# Altium schematic sheet WR_Clock.SchDoc: WR_Generator
size A3; Organization: Altium Limited; Address1: L3, 12a Rodborough Rd; Address2: Frenchs Forest; Address3: NSW; Address4: Australia 2086
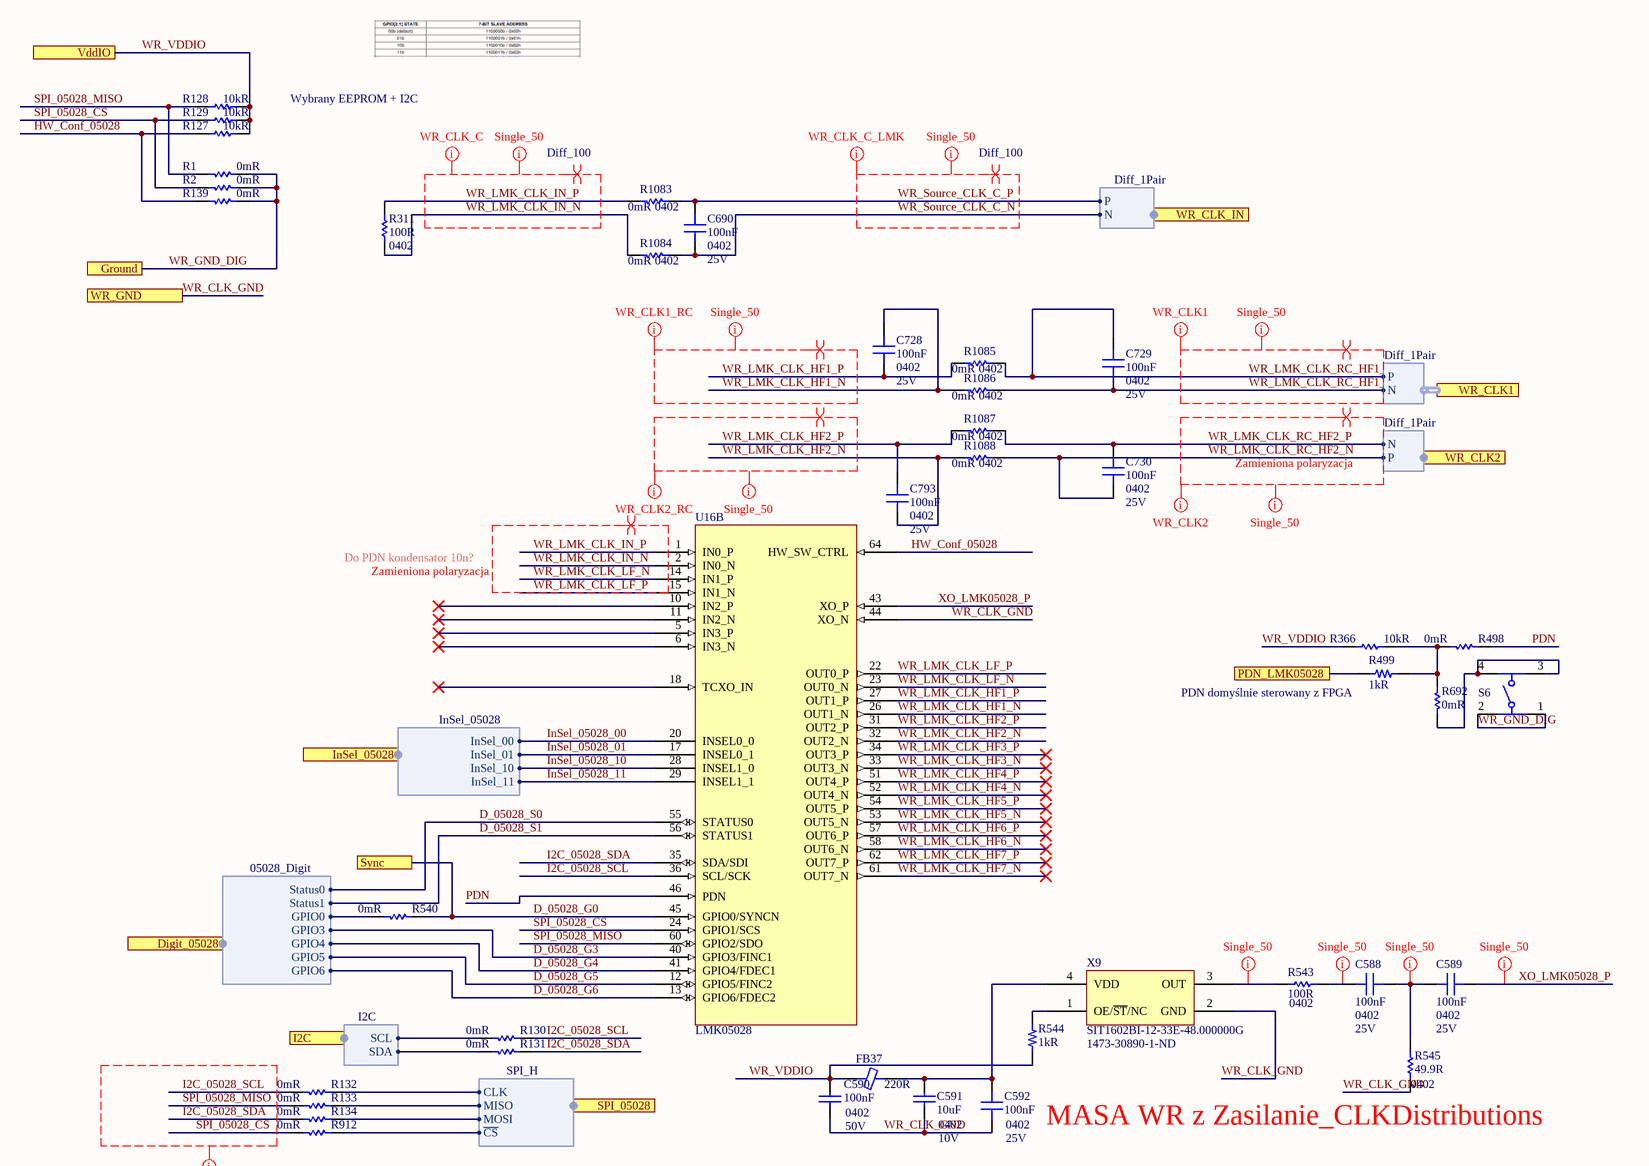
[diagram p0: WR_Clock.SchDoc]

## Parts
C588  100nF  Case/Package: 0402  Voltage Rating: 25V  [CAP 0402/1005 KK]
C589  100nF  Case/Package: 0402  Voltage Rating: 25V  [CAP 0402/1005 KK]
C590  100nF  Case Code (Imperial): 0402  Voltage: 50V  [CAP 0402/1005 KK]
C591  10uF  Case/Package: 0402  Voltage Rating: 10V  [CAP 0402/1005 KK]
C592  100nF  Case/Package: 0402  Voltage Rating: 25V  [CAP 0402/1005 KK]
C690  100nF  Case/Package: 0402  Voltage Rating: 25V  [CAP 0402/1005 KK]
C728  100nF  Case/Package: 0402  Voltage Rating: 25V  [CAP 0402/1005 KK]
C729  100nF  Case/Package: 0402  Voltage Rating: 25V  [CAP 0402/1005 KK]
C730  100nF  Case/Package: 0402  Voltage Rating: 25V  [CAP 0402/1005 KK]
C793  100nF  Case/Package: 0402  Voltage Rating: 25V  [CAP 0402/1005 KK]
FB37  220R  [FER 0603/1608]
R1  0mR  [RES 0402/1005 RF KK]
R2  0mR  [RES 0402/1005 RF KK]
R127  10kR  [RES 0402/1005 RF KK]
R128  10kR  [RES 0402/1005 RF KK]
R129  10kR  [RES 0402/1005 RF KK]
R130  0mR  [RES 0402/1005 RF KK]
R131  0mR  [RES 0402/1005 RF KK]
R132  0mR  [RES 0402/1005 RF KK]
R133  0mR  [RES 0402/1005 RF KK]
R134  0mR  [RES 0402/1005 RF KK]
R139  0mR  [RES 0402/1005 RF KK]
R311  100R  Case/Package: 0402  [RES 0402/1005 RF KK]
R366  10kR  [RES 0402/1005 RF KK]
R498  0mR  [RES 0402/1005 RF KK]
R499  1kR  [RES 0402/1005 RF KK]
R540  0mR  [RES 0402/1005 RF KK]
R543  100R  Case/Package: 0402  [RES 0402/1005 RF KK]
R544  1kR  [RES 0402/1005 RF KK]
R545  49.9R  Case/Package: 0402  [RES 0402/1005 RF KK]
R692  0mR  [RES 0402/1005 RF KK]
R912  0mR  [RES 0402/1005 RF KK]
R1083  0mR  Case/Package: 0402  [RES 0402/1005 RF KK]
R1084  0mR  Case/Package: 0402  [RES 0402/1005 RF KK]
R1085  0mR  Case/Package: 0402  [RES 0402/1005 RF KK]
R1086  0mR  Case/Package: 0402  [RES 0402/1005 RF KK]
R1087  0mR  Case/Package: 0402  [RES 0402/1005 RF KK]
R1088  0mR  Case/Package: 0402  [RES 0402/1005 RF KK]
S6  430181038816  [430181038816]  (value not drawn)
U16  LMK05028  [LMK05028]  (part B of 2)
X9  SIT1602BI-12-33E-48.000000G  Supplier Part Number 1: 1473-30890-1-ND  [SiT1602B]

## Ports
Digit_05028 (harness 05028_Digit), Ground, I2C (harness I2C), InSel_05028 (harness InSel_05028), PDN_LMK05028, SPI_05028 (harness SPI_H), Sync, VddIO, WR_CLK1 (harness Diff_1Pair), WR_CLK2 (harness Diff_1Pair), WR_CLK_IN (harness Diff_1Pair), WR_GND

## Harnesses
SPI_H: CLK, MISO, MOSI, ~{CS}
I2C: SDA, SCL
05028_Digit: GPIO4, GPIO3, Status0, GPIO6, Status1, GPIO5, GPIO0
Diff_1Pair: N, P
InSel_05028: InSel_00, InSel_01, InSel_10, InSel_11

## Nets
D_05028_G0: R540.1 U16.45(GPIO0/SYNCN) ; port Sync
D_05028_G3: U16.40(GPIO3/FINC1) ; port Digit_05028.GPIO3
D_05028_G4: U16.41(GPIO4/FDEC1) ; port Digit_05028.GPIO4
D_05028_G5: U16.12(GPIO5/FINC2) ; port Digit_05028.GPIO5
D_05028_G6: U16.13(GPIO6/FDEC2) ; port Digit_05028.GPIO6
D_05028_S0: U16.55(STATUS0) ; port Digit_05028.Status0
D_05028_S1: U16.56(STATUS1) ; port Digit_05028.Status1
HW_Conf_05028: R127.1 R139.2 U16.64(HW_SW_CTRL)
I2C_05028_SCL: R130.1 R132.2 U16.36(SCL/SCK)
I2C_05028_SDA: R131.1 R134.2 U16.35(SDA/SDI)
InSel_05028_00: U16.20(INSEL0_0) ; port InSel_05028.InSel_00
InSel_05028_01: U16.17(INSEL0_1) ; port InSel_05028.InSel_01
InSel_05028_10: U16.28(INSEL1_0) ; port InSel_05028.InSel_10
InSel_05028_11: U16.29(INSEL1_1) ; port InSel_05028.InSel_11
PDN: R498.1 U16.46(PDN)
PDN_LMK05028: R499.1 ; port PDN_LMK05028
SPI_05028_CS: R2.2 R129.1 R912.2 U16.24(GPIO1/SCS)
SPI_05028_MISO: R1.2 R128.1 R133.2 U16.60(GPIO2/SDO)
WR_CLK_GND: C590.1 C591.1 C592.1 R545.1 U16.44(XO_N) X9.2(GND) ; port WR_GND
WR_GND_DIG: R1.1 R2.1 R139.1 S6.1 S6.2 ; port Ground
WR_LMK_CLK_HF1_N: C728.1 R1086.2 U16.26(OUT1_N)
WR_LMK_CLK_HF1_P: C728.2 R1085.2 U16.27(OUT1_P)
WR_LMK_CLK_HF2_N: C793.2 R1088.2 U16.32(OUT2_N)
WR_LMK_CLK_HF2_P: C793.1 R1087.2 U16.31(OUT2_P)
WR_LMK_CLK_HF3_N: U16.33(OUT3_N)
WR_LMK_CLK_HF3_P: U16.34(OUT3_P)
WR_LMK_CLK_HF4_N: U16.52(OUT4_N)
WR_LMK_CLK_HF4_P: U16.51(OUT4_P)
WR_LMK_CLK_HF5_N: U16.53(OUT5_N)
WR_LMK_CLK_HF5_P: U16.54(OUT5_P)
WR_LMK_CLK_HF6_N: U16.58(OUT6_N)
WR_LMK_CLK_HF6_P: U16.57(OUT6_P)
WR_LMK_CLK_HF7_N: U16.61(OUT7_N)
WR_LMK_CLK_HF7_P: U16.62(OUT7_P)
WR_LMK_CLK_IN_N: R311.1 R1084.2 U16.2(IN0_N)
WR_LMK_CLK_IN_P: R311.2 R1083.2 U16.1(IN0_P)
WR_LMK_CLK_LF_N: U16.14(IN1_P) U16.23(OUT0_N)
WR_LMK_CLK_LF_P: U16.15(IN1_N) U16.22(OUT0_P)
WR_LMK_CLK_RC_HF1_N: C729.2 R1086.1 ; port WR_CLK1.N
WR_LMK_CLK_RC_HF1_P: C729.1 R1085.1 ; port WR_CLK1.P
WR_LMK_CLK_RC_HF2_N: C730.2 R1088.1 ; port WR_CLK2.P
WR_LMK_CLK_RC_HF2_P: C730.1 R1087.1 ; port WR_CLK2.N
WR_Source_CLK_C_N: C690.2 R1084.1 ; port WR_CLK_IN.N
WR_Source_CLK_C_P: C690.1 R1083.1 ; port WR_CLK_IN.P
WR_VDDIO: C590.2 FB37.1 R127.2 R128.2 R129.2 R366.1 R544.2 ; port VddIO
XO_LMK05028_P: C589.1 U16.43(XO_P)
NetC588_1: C588.1 C589.2 R545.2
NetC588_2: C588.2 R543.2
NetC591_2: C591.2 C592.2 FB37.2 X9.4(VDD)
NetR130_2: R130.2 ; port I2C.SCL
NetR131_2: R131.2 ; port I2C.SDA
NetR132_1: R132.1 ; port SPI_05028.CLK
NetR133_1: R133.1 ; port SPI_05028.MISO
NetR134_1: R134.1 ; port SPI_05028.MOSI
NetR366_2: R366.2 R498.2 R499.2 R692.1
NetR540_2: R540.2 ; port Digit_05028.GPIO0
NetR543_1: R543.1 X9.3(OUT)
NetR544_1: R544.1 X9.1(OE/~{ST}/NC)
NetR692_2: R692.2 S6.3 S6.4
NetR912_1: R912.1 ; port SPI_05028.~{CS}

Not connected (* = marked no-connect by the designer): U16 5(IN3_P)* 6(IN3_N)* 10(IN2_P)* 11(IN2_N)* 18(TCXO_IN)*

## Layout directives
net class Single_50: NetC588_1, NetC588_2, NetR543_1, WR_LMK_CLK_HF1_N, WR_LMK_CLK_HF1_P, WR_LMK_CLK_HF2_N, WR_LMK_CLK_HF2_P, WR_LMK_CLK_IN_N, WR_LMK_CLK_IN_P, WR_LMK_CLK_RC_HF1_N, WR_LMK_CLK_RC_HF1_P, WR_LMK_CLK_RC_HF2_N, WR_LMK_CLK_RC_HF2_P, WR_Source_CLK_C_N, WR_Source_CLK_C_P, XO_LMK05028_P
net class WR_CLK1: WR_LMK_CLK_RC_HF1_N, WR_LMK_CLK_RC_HF1_P
net class WR_CLK2: WR_LMK_CLK_RC_HF2_N, WR_LMK_CLK_RC_HF2_P
net class WR_CLK_C_LMK: WR_Source_CLK_C_N, WR_Source_CLK_C_P
differential pair; differential pair class Diff_100: WR_LMK_CLK_HF1_N, WR_LMK_CLK_HF1_P, WR_LMK_CLK_HF2_N, WR_LMK_CLK_HF2_P, WR_LMK_CLK_IN_N, WR_LMK_CLK_IN_P, WR_LMK_CLK_LF_N, WR_LMK_CLK_LF_P, WR_LMK_CLK_RC_HF1_N, WR_LMK_CLK_RC_HF1_P, WR_LMK_CLK_RC_HF2_N, WR_LMK_CLK_RC_HF2_P, WR_Source_CLK_C_N, WR_Source_CLK_C_P
net class WR_CLK_C: WR_LMK_CLK_IN_N, WR_LMK_CLK_IN_P
net class WR_CLK2_RC: WR_LMK_CLK_HF2_N, WR_LMK_CLK_HF2_P
net class WR_CLK1_RC: WR_LMK_CLK_HF1_N, WR_LMK_CLK_HF1_P
net class SPI_05028: I2C_05028_SCL, I2C_05028_SDA, SPI_05028_CS, SPI_05028_MISO

## Notes on the sheet
- Wybrany EEPROM + I2C
- Zamieniona polaryzacja
- Do PDN kondensator 10n?
- (near R499) PDN domyślnie sterowany z FPGA
- (near R545) MASA WR z Zasilanie_CLKDistributions
- Title
- Size:
- Date:
- A3
- Number:
- Time:
- Revision:
- Sheet
- of
- File:

## Library data of the parts
C588 C589 C592 C690 C728-C730 C793 = Capacitor: Manufacturer: Murata; Manufacturer Part Number: GRM155R71E104KE14J; Tolerance: 10%; Dielectric: X7R; Supplier 1: Digi-Key; Supplier Part Number 1: 490-14603-1-ND; Stock 1: 89275; Pricing 1: 1 = 0,10000, 10 = 0,03400, 100 = 0,01520, 500 = 0,01088, 1000 = 0,00855, 2500 = 0,00778, 5000 = 0,00715 (USD); RoHS: Yes; Mount: Surface Mount; Weight: 0.000212oz; Case Code (Imperial): 0402; Case Code (Metric): 1005; Min Operating Temperature: -55°C; Max Operating Temperature: 125°C; Packaging: Tape and Reel; Capacitance: 100nF; Termination: SMD/SMT; Composition: Ceramic; Voltage Rating (DC): 25V; Package Quantity: 50000; Length: 0.039inch; Height: 0.5mm; Width: 0.5mm; Thickness: 0.022inch; ComponentLink1URL: http://www.mouser.com/ds/2/281/c02e-2905.pdf?src-supplier=Mouser; ComponentLink1Description: http://www.mouser.com/ds/2/281/c02e-2905.pdf?src-supplier=Mouser; ComponentLink2URL: http://search.murata.co.jp/Ceramy/image/img/A01X/G101/ENG/GRM155R71E104KE14-01.pdf?src-supplier=Digi-Key; ComponentLink2Description: http://search.murata.co.jp/Ceramy/image/img/A01X/G101/ENG/GRM155R71E104KE14-01.pdf?src-supplier=Digi-Key
C590 = Capacitor: CAP CER 0.1UF 50V X5R 0402; Manufacturer: Murata; Manufacturer Part Number: GRM155R61H104KE14D; Dielectric Material: Ceramic; Dissipation Factor: 0.025%; Tolerance: 10%; Supplier 1: Digi-Key; Supplier Part Number 1: 490-10697-1-ND; RoHS: Yes; Category: Ceramic Capacitors; Stock 1: 435607; Pricing 1: 1=0,10000, 10=0,04600, 100=0,02050, 500=0,01464, 1000=0,01150, 2500=0,01045, 5000=0,00961 (USD); Mount: Surface Mount; Case/Package: 0402; Weight: 0.000212oz; Case Code (Metric): 1005; Min Operating Temperature: -55°C; Max Operating Temperature: 85°C; Capacitance: 100nF; Packaging: Tape and Reel; Voltage Rating: 50V; Dielectric: X5R; Termination: SMD/SMT; Composition: Ceramic; Voltage Rating (DC): 50V; Package Quantity: 10000; Length: 1mm; Height: 0.5mm; Width: 0.02inch; Thickness: 0.022inch; Depth: 0.5mm; REACH SVHC: No SVHC; Lead Free: Lead Free; ComponentLink1URL: http://www.farnell.com/datasheets/2079150.pdf?src-supplier=Farnell; ComponentLink1Description: http://www.farnell.com/datasheets/2079150.pdf?src-supplier=Farnell; ComponentLink2URL: http://www.mouser.com/ds/2/281/c02e-2905.pdf?src-supplier=Mouser; ComponentLink2Description: http://www.mouser.com/ds/2/281/c02e-2905.pdf?src-supplier=Mouser; ComponentLink3URL: http://www.farnell.com/datasheets/2079150.pdf?src-supplier=Element14; ComponentLink3Description: http://www.farnell.com/datasheets/2079150.pdf?src-supplier=Element14; ComponentLink4URL: http://search.murata.co.jp/Ceramy/image/img/A01X/G101/ENG/GRM155R61H104KE14-01.pdf?src-supplier=Digi-Key; ComponentLink4Description: http://search.murata.co.jp/Ceramy/image/img/A01X/G101/ENG/GRM155R61H104KE14-01.pdf?src-supplier=Digi-Key
C591 = Capacitor: CAP CER 10UF 10V X5R 0402; Manufacturer: Samsung; Manufacturer Part Number: CL05A106MP8NUB8; Tolerance: 20%; Supplier 1: Digi-Key; Supplier Part Number 1: 1276-6830-1-ND; RoHS: Yes; Category: Ceramic Capacitors; Stock 1: 996737; Pricing 1: 1=0,47000, 10=0,32400, 100=0,19410, 500=0,14558, 1000=0,12293, 2500=0,11646 (USD); Mount: Surface Mount; Case Code (Metric): 1005; Case Code (Imperial): 0402; Min Operating Temperature: -55°C; Max Operating Temperature: 85°C; Packaging: Tape and Reel; Capacitance: 10uF; Length: 0.039inch; Width: 0.02inch; Thickness: 0.035inch; ComponentLink1URL: http://www.samsungsem.com/kr/support/product-search/mlcc/CL05A106MP8NUB8.jsp?src-supplier=Digi-Key; ComponentLink1Description: http://www.samsungsem.com/kr/support/product-search/mlcc/CL05A106MP8NUB8.jsp?src-supplier=Digi-Key
FB37 = Ferrite: FERRITE BEAD 220 OHM 0603 1LN; Manufacturer: Murata; Manufacturer Part Number: BLM18SG221TN1D; Material: Ferrite,Steel; Tolerance: 25%; Max Current Rating: 2.5A; Number of Lines: 1; DC Resistance (DCR): 40mR; Test Frequency: 100MHz; Supplier 1: Digi-Key; Supplier Part Number 1: 490-5225-1-ND; RoHS: Yes; Category: Inductors; Stock 1: 123623; Pricing 1: 1=0,14000, 10=0,11600, 25=0,09040, 50=0,07500, 100=0,06460, 250=0,05172, 500=0,04654, 1000=0,03878, 5000=0,03619 (USD); Case/Package: 0603; Number of Pins: 2; Weight: 7.1E-05oz; Core Material: Ferrite; Case Code (Metric): 1608; Case Code (Imperial): 0603; Min Operating Temperature: -55°C; Max Operating Temperature: 125°C; Package Quantity: 1; Impedance: 220R; Packaging: Tape and Reel; Current Rating: 2.5A; Termination: SMD/SMT; Max DC Current: 2.5A; DC Current: 2.5A; Number of Circuits: 1; Length: 1.6mm; Height: 0.8mm; Width: 0.8mm; Depth: 0.95mm; Radiation Hardening: No; REACH SVHC: No SVHC; Lead Free: Lead Free; ComponentLink1URL: https://datasheet.ciiva.com/1561/c31e-1561456.pdf?src-supplier=Newark; ComponentLink1Description: https://datasheet.ciiva.com/1561/c31e-1561456.pdf?src-supplier=Newark; ComponentLink2URL: https://datasheet.ciiva.com/41449/001171724-da-01-en-chip-drossel0603-220r-2500ma-1-6x0-8mm-41449352.pdf?src-supplier=Conrad; ComponentLink2Description: https://datasheet.ciiva.com/41449/001171724-da-01-en-chip-drossel0603-220r-2500ma-1-6x0-8mm-41449352.pdf?src-supplier=Conrad; ComponentLink3URL: https://datasheet.ciiva.com/41449/001172313-da-01-en-drossel-0603-220r-21-6x0-8mm-10000st-41449677.pdf?src-supplier=Conrad; ComponentLink3Description: https://datasheet.ciiva.com/41449/001172313-da-01-en-drossel-0603-220r-21-6x0-8mm-10000st-41449677.pdf?src-supplier=Conrad; ComponentLink4URL: https://datasheet.ciiva.com/1012/l0110s0100blm18s-1012626.pdf?src-supplier=Digi-Key; ComponentLink4Description: https://datasheet.ciiva.com/1012/l0110s0100blm18s-1012626.pdf?src-supplier=Digi-Key; ComponentLink5URL: https://datasheet.ciiva.com/1012/l0110s0100blm18s-1012627.pdf?src-supplier=Digi-Key; ComponentLink5Description: https://datasheet.ciiva.com/1012/l0110s0100blm18s-1012627.pdf?src-supplier=Digi-Key; ComponentLink6URL: https://datasheet.ciiva.com/1012/l0110s0100blm18s-1012628.pdf?src-supplier=Digi-Key; ComponentLink6Description: https://datasheet.ciiva.com/1012/l0110s0100blm18s-1012628.pdf?src-supplier=Digi-Key; ComponentLink7URL: https://datasheet.ciiva.com/17279/l0110s0100blm18s-17279573.pdf?src-supplier=Avnet+Europe; ComponentLink7Description: https://datasheet.ciiva.com/17279/l0110s0100blm18s-17279573.pdf?src-supplier=Avnet+Europe; ComponentLink8URL: https://datasheet.ciiva.com/8508/l0110s0100blm18s-8508310.pdf?src-supplier=Avnet; ComponentLink8Description: https://datasheet.ciiva.com/8508/l0110s0100blm18s-8508310.pdf?src-supplier=Avnet; ComponentLink9URL: https://datasheet.ciiva.com/8021/5151-8021517.pdf?src-supplier=Element14; ComponentLink9Description: https://datasheet.ciiva.com/8021/5151-8021517.pdf?src-supplier=Element14; ComponentLink10URL: https://datasheet.ciiva.com/16204/l0110s0100blm18s-16204029.pdf?src-supplier=Future+Electronics; ComponentLink10Description: https://datasheet.ciiva.com/16204/l0110s0100blm18s-16204029.pdf?src-supplier=Future+Electronics; ComponentLink11URL: https://datasheet.ciiva.com/14122/blm-series-eng-tds-14122910.pdf?src-supplier=Distrelec; ComponentLink11Description: https://datasheet.ciiva.com/14122/blm-series-eng-tds-14122910.pdf?src-supplier=Distrelec; ComponentLink12URL: https://datasheet.ciiva.com/8021/5151-8021519.pdf?src-supplier=Element14; ComponentLink12Description: https://datasheet.ciiva.com/8021/5151-8021519.pdf?src-supplier=Element14
R1 R2 R130-R134 R139 R498 R540 R692 R912 R1083-R1088 = Resistor: Manufacturer 1: Yageo; Manufacturer Part Number 1: RC0402JR-070RL; Power Rating: 62.5mW; Tolerance: 5%; Voltage Rating: 50V; Max Power Dissipation: 63mW; Temperature Coefficient: 200ppm/°C; Supplier 1: Digi-Key; Supplier Part Number 1: 311-0.0JRCT-ND; Stock 1: 69822252; Pricing 1: 1=0.10000, 10=0.01200, 25=0.00920, 50=0.00680, 100=0.00510, 250=0.00388, 500=0.00308, 1000=0.00227, 5000=0.00163 (USD); RoHS: Yes; Contact Plating: Tin,Matte; Case Code (Metric): 1005; Case Code (Imperial): 0402; Min Operating Temperature: -55°C; Max Operating Temperature: 155°C; Resistance: 0mR; Packaging: Tape and Reel; Composition: Thick Film; Package Quantity: 1; Number of Terminations: 2; Termination: SMD/SMT; Military Standard: Not; Features: Moisture Resistant; Length: 1mm; Height: 0.016inch; Width: 0.02inch; Depth: 0.5mm; Radiation Hardening: No; REACH SVHC: Unknown; Lead Free: Lead Free; ComponentLink1URL: https://datasheet.ciiva.com/2452/pyu-rc0402-51-rohs-l-6-2452608.pdf?src-supplier=Digi-Key; ComponentLink1Description: https://datasheet.ciiva.com/2452/pyu-rc0402-51-rohs-l-6-2452608.pdf?src-supplier=Digi-Key; ComponentLink2URL: https://datasheet.ciiva.com/11808/0900766b80c66297-11808195.pdf?src-supplier=RSComponents; ComponentLink2Description: https://datasheet.ciiva.com/11808/0900766b80c66297-11808195.pdf?src-supplier=RSComponents; ComponentLink3URL: https://datasheet.ciiva.com/2452/pyu-r-int-thick-7-2452609.pdf?src-supplier=Digi-Key; ComponentLink3Description: https://datasheet.ciiva.com/2452/pyu-r-int-thick-7-2452609.pdf?src-supplier=Digi-Key; ComponentLink4URL: https://datasheet.ciiva.com/22747/1018594-22747515.pdf?src-supplier=Element14; ComponentLink4Description: https://datasheet.ciiva.com/22747/1018594-22747515.pdf?src-supplier=Element14; ComponentLink5URL: https://datasheet.ciiva.com/7983/1018594-7983535.pdf?src-supplier=Element14; ComponentLink5Description: https://datasheet.ciiva.com/7983/1018594-7983535.pdf?src-supplier=Element14; ComponentLink6URL: https://datasheet.ciiva.com/2452/pyu-r-int-thick-7-2452610.pdf?src-supplier=Digi-Key; ComponentLink6Description: https://datasheet.ciiva.com/2452/pyu-r-int-thick-7-2452610.pdf?src-supplier=Digi-Key; ComponentLink7URL: https://datasheet.ciiva.com/8896/pyu-rc0402-51-rohs-l-6-8896201.pdf?src-supplier=Avnet; ComponentLink7Description: https://datasheet.ciiva.com/8896/pyu-rc0402-51-rohs-l-6-8896201.pdf?src-supplier=Avnet; ComponentLink8URL: https://datasheet.ciiva.com/28386/pyu-rc0402-51-rohs-l-6-28386633.pdf?src-supplier=Avnet+Europe; ComponentLink8Description: https://datasheet.ciiva.com/28386/pyu-rc0402-51-rohs-l-6-28386633.pdf?src-supplier=Avnet+Europe; ComponentLink9URL: https://datasheet.ciiva.com/15189/getdatasheetpartid-326379-15189533.pdf?src-supplier=Verical; ComponentLink9Description: https://datasheet.ciiva.com/15189/getdatasheetpartid-326379-15189533.pdf?src-supplier=Verical
  R1 R2 R130-R134 R139 R498 R540 R692 R912: Case/Package: 0402
R127-R129 R366 = Resistor: Manufacturer 1: Yageo; Manufacturer Part Number 1: RC0402FR-0710KL; Tolerance: 1%; Temperature Coefficient: 100ppm/°C; Voltage Rating: 50V; Power Rating: 62.5mW; Supplier 1: Digi-Key; Supplier Part Number 1: 311-10.0KLRCT-ND; Stock 1: 71214322; Pricing 1: 1=0,10000, 10=0,01500, 100=0,00600, 1000=0,00270, 2500=0,00235, 5000=0,00194 (USD); RoHS: Yes; Case/Package: 0402; Number of Pins: 2; Case Code (Imperial): 0402; Case Code (Metric): 1005; Min Operating Temperature: -55°C; Max Operating Temperature: 155°C; Resistance: 10kR; Packaging: Tape and Reel; Composition: Thick Film; Voltage Rating (DC): 50V; Termination: SMD/SMT; Military Standard: Not; Working Voltage: 50V; Number of Terminations: 2; Length: 1mm; Height: 0.32mm; Width: 0.5mm; Depth: 0.5mm; Lead Pitch: 0.2mm; REACH SVHC: No SVHC; Lead Free: Lead Free; ComponentLink1URL: https://datasheet.ciiva.com/7660/38568-7660787.pdf?src-supplier=Element14; ComponentLink1Description: https://datasheet.ciiva.com/7660/38568-7660787.pdf?src-supplier=Element14; ComponentLink2URL: https://datasheet.ciiva.com/7849/1784430-7849813.pdf?src-supplier=Element14; ComponentLink2Description: https://datasheet.ciiva.com/7849/1784430-7849813.pdf?src-supplier=Element14; ComponentLink3URL: https://datasheet.ciiva.com/7849/1686128-7849814.pdf?src-supplier=Element14; ComponentLink3Description: https://datasheet.ciiva.com/7849/1686128-7849814.pdf?src-supplier=Element14; ComponentLink4URL: https://datasheet.ciiva.com/7849/1784430-7849815.pdf?src-supplier=Element14; ComponentLink4Description: https://datasheet.ciiva.com/7849/1784430-7849815.pdf?src-supplier=Element14; ComponentLink5URL: https://datasheet.ciiva.com/22747/1018594-22747512.pdf?src-supplier=Element14; ComponentLink5Description: https://datasheet.ciiva.com/22747/1018594-22747512.pdf?src-supplier=Element14; ComponentLink6URL: https://datasheet.ciiva.com/12667/pyu-rc0402-51-rohs-l-6-r-12667067.pdf?src-supplier=Mouser; ComponentLink6Description: https://datasheet.ciiva.com/12667/pyu-rc0402-51-rohs-l-6-r-12667067.pdf?src-supplier=Mouser; ComponentLink7URL: https://datasheet.ciiva.com/7983/1018594-7983486.pdf?src-supplier=Element14; ComponentLink7Description: https://datasheet.ciiva.com/7983/1018594-7983486.pdf?src-supplier=Element14
R311 R543 = Resistor: RES SMD 100 OHM 1% 1/16W 0402; Manufacturer: Yageo; Manufacturer Part Number: RC0402FR-07100RL; Power Rating: 62.5mW; Voltage Rating: 50V; Temperature Coefficient: 100ppm/°C; Supplier 1: Digi-Key; Supplier Part Number 1: 311-100LRDKR-ND; RoHS: Yes; Category: Chip SMD Resistors; Stock 1: 42078262; Pricing 1: 1=0,10000, 10=0,01600, 100=0,00640, 1000=0,00289, 2500=0,00251, 5000=0,00207 (USD); Number of Pins: 2; Case Code (Imperial): 0402; Case Code (Metric): 1005; Min Operating Temperature: -55°C; Max Operating Temperature: 155°C; Tolerance: 1%; Resistance: 100R; Packaging: Tape and Reel; Termination: SMD/SMT; Composition: Thick Film; Military Standard: Not; Voltage Rating (DC): 50V; Length: 1mm; Height: 0.32mm; Depth: 0.5mm; Width: 0.5mm; REACH SVHC: No SVHC; Lead Free: Lead Free; ComponentLink1URL: https://datasheet.ciiva.com/7849/1784430-7849810.pdf?src-supplier=Element14; ComponentLink1Description: https://datasheet.ciiva.com/7849/1784430-7849810.pdf?src-supplier=Element14; ComponentLink2URL: https://datasheet.ciiva.com/11808/0900766b80c66297-11808765.pdf?src-supplier=RSComponents; ComponentLink2Description: https://datasheet.ciiva.com/11808/0900766b80c66297-11808765.pdf?src-supplier=RSComponents; ComponentLink3URL: https://datasheet.ciiva.com/12667/pyu-rc0402-51-rohs-l-6-r-12667957.pdf?src-supplier=Mouser; ComponentLink3Description: https://datasheet.ciiva.com/12667/pyu-rc0402-51-rohs-l-6-r-12667957.pdf?src-supplier=Mouser; ComponentLink4URL: https://datasheet.ciiva.com/16740/pyu-rc0402-51-rohs-l-6-r-16740566.pdf?src-supplier=Future+Electronics; ComponentLink4Description: https://datasheet.ciiva.com/16740/pyu-rc0402-51-rohs-l-6-r-16740566.pdf?src-supplier=Future+Electronics; ComponentLink5URL: https://datasheet.ciiva.com/15189/getdatasheetpartid-329466-15189335.pdf?src-supplier=Verical; ComponentLink5Description: https://datasheet.ciiva.com/15189/getdatasheetpartid-329466-15189335.pdf?src-supplier=Verical; ComponentLink6URL: https://datasheet.ciiva.com/28367/1018594-28367226.pdf?src-supplier=Element14; ComponentLink6Description: https://datasheet.ciiva.com/28367/1018594-28367226.pdf?src-supplier=Element14; ComponentLink7URL: https://datasheet.ciiva.com/22747/1018594-22747511.pdf?src-supplier=Element14; ComponentLink7Description: https://datasheet.ciiva.com/22747/1018594-22747511.pdf?src-supplier=Element14
R499 R544 = Resistor: Manufacturer: Panasonic; Manufacturer Part Number: ERJ-2RKF1001X; Tolerance: 1%; Power Rating: 100mW; Temperature Coefficient: 100ppm/°C; Voltage Rating: 50V; Supplier 1: Digi-Key; Supplier Part Number 1: P1.00KLCT-ND; Stock 1: 6683975; Pricing 1: 1 = 0,10000, 10 = 0,05200, 100 = 0,02130, 1000 = 0,00958, 2500 = 0,00832, 5000 = 0,00687 (USD); RoHS: Yes; Mount: Surface Mount; Case/Package: 0402; Number of Pins: 2; Case Code (Imperial): 0402; Case Code (Metric): 1005; Contact Plating: Tin; Min Operating Temperature: -55°C; Max Operating Temperature: 155°C; Resistance: 1kR; Packaging: Tape and Reel; Composition: Thick Film; Termination: SMD/SMT; Package Quantity: 1; Military Standard: Not; Number of Terminations: 2; Max Power Dissipation: 100mW; Voltage Rating (DC): 50V; Features: Automotive AEC-Q200; Working Voltage: 50V; Length: 1mm; Height: 0.35mm; Width: 0.5mm; Depth: 0.5mm; Radiation Hardening: No; Lead Free: Lead Free; REACH SVHC: No SVHC; ComponentLink1URL: https://datasheet.ciiva.com/11821/0900766b80f80784-11821203.pdf?src-supplier=RSComponents; ComponentLink1Description: https://datasheet.ciiva.com/11821/0900766b80f80784-11821203.pdf?src-supplier=RSComponents; ComponentLink2URL: https://datasheet.ciiva.com/16767/70260748-16767559.pdf?src-supplier=Allied+Electronics; ComponentLink2Description: https://datasheet.ciiva.com/16767/70260748-16767559.pdf?src-supplier=Allied+Electronics; ComponentLink3URL: https://datasheet.ciiva.com/9198/aoa0000ce2-9198920.pdf?src-supplier=Avnet; ComponentLink3Description: https://datasheet.ciiva.com/9198/aoa0000ce2-9198920.pdf?src-supplier=Avnet; ComponentLink4URL: https://datasheet.ciiva.com/7942/aoa0000ce2-7942426.pdf?src-supplier=Element14; ComponentLink4Description: https://datasheet.ciiva.com/7942/aoa0000ce2-7942426.pdf?src-supplier=Element14; ComponentLink5URL: https://datasheet.ciiva.com/16771/70260748-16771979.pdf?src-supplier=Allied+Electronics; ComponentLink5Description: https://datasheet.ciiva.com/16771/70260748-16771979.pdf?src-supplier=Allied+Electronics; ComponentLink6URL: https://datasheet.ciiva.com/17215/aoa0000ce2-17215308.pdf?src-supplier=Avnet+Europe; ComponentLink6Description: https://datasheet.ciiva.com/17215/aoa0000ce2-17215308.pdf?src-supplier=Avnet+Europe; ComponentLink7URL: https://datasheet.ciiva.com/28532/1678782-28532109.pdf?src-supplier=Element14; ComponentLink7Description: https://datasheet.ciiva.com/28532/1678782-28532109.pdf?src-supplier=Element14; ComponentLink8URL: https://datasheet.ciiva.com/16523/aoa0000ce2-16523834.pdf?src-supplier=Avnet+Asia; ComponentLink8Description: https://datasheet.ciiva.com/16523/aoa0000ce2-16523834.pdf?src-supplier=Avnet+Asia; ComponentLink9URL: https://datasheet.ciiva.com/22673/1678782-22673916.pdf?src-supplier=Element14; ComponentLink9Description: https://datasheet.ciiva.com/22673/1678782-22673916.pdf?src-supplier=Element14
R545 = Resistor: RES SMD 49.9 OHM 1% 1/16W 0402; Manufacturer: Yageo; Manufacturer Part Number: RC0402FR-0749R9L; Voltage Rating (DC): 50V; Power Rating: 62.5mW; Temperature Coefficient: 100ppm/°C; Max Power Dissipation: 63mW; Supplier 1: Digi-Key; Supplier Part Number 1: 311-49.9LRDKR-ND; RoHS: Yes; Category: Chip SMD Resistors; Stock 1: 13702459; Pricing 1: 1=0,10000, 10=0,01600, 100=0,00640, 1000=0,00289, 2500=0,00251, 5000=0,00207 (USD); Number of Pins: 2; Case Code (Imperial): 0402; Case Code (Metric): 1005; Min Operating Temperature: -55°C; Max Operating Temperature: 155°C; Packaging: Tape and Reel; Tolerance: 1%; Package Quantity: 1; Features: Moisture Resistant; Resistance: 49.9R; Voltage Rating: 50V; Termination: SMD/SMT; Composition: Thick Film; Number of Terminations: 2; Military Standard: Not; Working Voltage: 50V; Length: 1mm; Height: 0.016inch; Width: 0.5mm; Depth: 0.5mm; Lead Free: Lead Free; REACH SVHC: No SVHC; ComponentLink1URL: https://datasheet.ciiva.com/11819/0900766b80c66297-11819508.pdf?src-supplier=RSComponents; ComponentLink1Description: https://datasheet.ciiva.com/11819/0900766b80c66297-11819508.pdf?src-supplier=RSComponents; ComponentLink2URL: https://datasheet.ciiva.com/7983/1018594-7983542.pdf?src-supplier=Element14; ComponentLink2Description: https://datasheet.ciiva.com/7983/1018594-7983542.pdf?src-supplier=Element14; ComponentLink3URL: https://datasheet.ciiva.com/16743/pyu-rc0402-51-rohs-l-6-r-16743942.pdf?src-supplier=Future+Electronics; ComponentLink3Description: https://datasheet.ciiva.com/16743/pyu-rc0402-51-rohs-l-6-r-16743942.pdf?src-supplier=Future+Electronics; ComponentLink4URL: https://datasheet.ciiva.com/22747/1018594-22747514.pdf?src-supplier=Element14; ComponentLink4Description: https://datasheet.ciiva.com/22747/1018594-22747514.pdf?src-supplier=Element14; ComponentLink5URL: https://datasheet.ciiva.com/2453/pyu-r-int-thick-7-2453355.pdf?src-supplier=Digi-Key; ComponentLink5Description: https://datasheet.ciiva.com/2453/pyu-r-int-thick-7-2453355.pdf?src-supplier=Digi-Key; ComponentLink6URL: https://datasheet.ciiva.com/2453/pyu-r-int-thick-7-2453356.pdf?src-supplier=Digi-Key; ComponentLink6Description: https://datasheet.ciiva.com/2453/pyu-r-int-thick-7-2453356.pdf?src-supplier=Digi-Key; ComponentLink7URL: https://datasheet.ciiva.com/2453/pyu-r-int-thick-7-2453357.pdf?src-supplier=Digi-Key; ComponentLink7Description: https://datasheet.ciiva.com/2453/pyu-r-int-thick-7-2453357.pdf?src-supplier=Digi-Key
S6 = 430181038816: WS-TASV SMT Tact Switch 4.5x4.5mm, height 3.8mm, 160gf; Rated Voltage: 12VDC; Rated Current: 50mA; Washable: No; ComponentLink1Description: Manufacturer; ComponentLink1URL: http://www.we-online.de; ComponentLink2Description: Datasheet; ComponentLink2URL: https://katalog.we-online.com/em/datasheet/430181038816.pdf; Operating Temperature: -40 to +85degC; Part Number: 430181038816; Published Date: September 2019; Contact Material: Stainless Steel; Height: 3.8mm; Mounting Technology: SMT; Contact Plating: Silver; Operation Force: 160gf; Packaging: Tape and Reel; Terminal Material: Copper Alloy; Publisher: Wurth Elektronik; Terminal Plating: Silver
U16 = LMK05028: Manufacturer Part Number: LMK05028RGCR; Manufacturer: Texas Instruments; Number of Inputs: 4; Number of Outputs: 8; Supplier 1: Digi-Key; Supplier 2: Digi-Key; Supplier 3: Mouser; Supplier Part Number 1: 296-49099-1-ND; Supplier Part Number 2: 296-49099-6-ND; Supplier Part Number 3: 595-LMK05028RGCT; Stock 1: 230; Pricing 1: 1 = 32,36000, 10 = 29,84800, 100 = 25,48800 (USD); RoHS: No; ComponentLink1URL: http://www.ti.com/lit/ds/symlink/lmk05028.pdf?src-supplier=Digi-Key; ComponentLink1Description: http://www.ti.com/lit/ds/symlink/lmk05028.pdf?src-supplier=Digi-Key
X9 = SIT1602BI-12-33E-48.000000G: OSC MEMS 48.0000MHZ LVCMOS SMD; Manufacturer: SiTime; Frequency: 48MHz; Max Supply Current: 4.5mA; Frequency Stability: 25ppm; Supplier 1: Digi-Key; Manufacturer Part Number: SIT1602BI-12-33E-48.000000G; RoHS: Yes; Category: Oscillators; Stock 1: 283; Pricing 1: 1=1,36000, 10=1,30100, 50=1,27060, 100=1,08900 (USD); Mount: Surface Mount; Case/Package: SMD/SMT; Min Operating Temperature: -40°C; Max Operating Temperature: 85°C; Packaging: Tape and Reel; Length: 0.098inch; Height: 0.032inch; Width: 0.079inch; ComponentLink1URL: https://www.sitime.com/products/datasheets/sit1602/SiT1602B-datasheet.pdf?src-supplier=Digi-Key; ComponentLink1Description: https://www.sitime.com/products/datasheets/sit1602/SiT1602B-datasheet.pdf?src-supplier=Digi-Key